# Altium schematic sheet MP_CTRL1.SchDoc
size A3; SheetNumber: 5; SheetTotal: 16
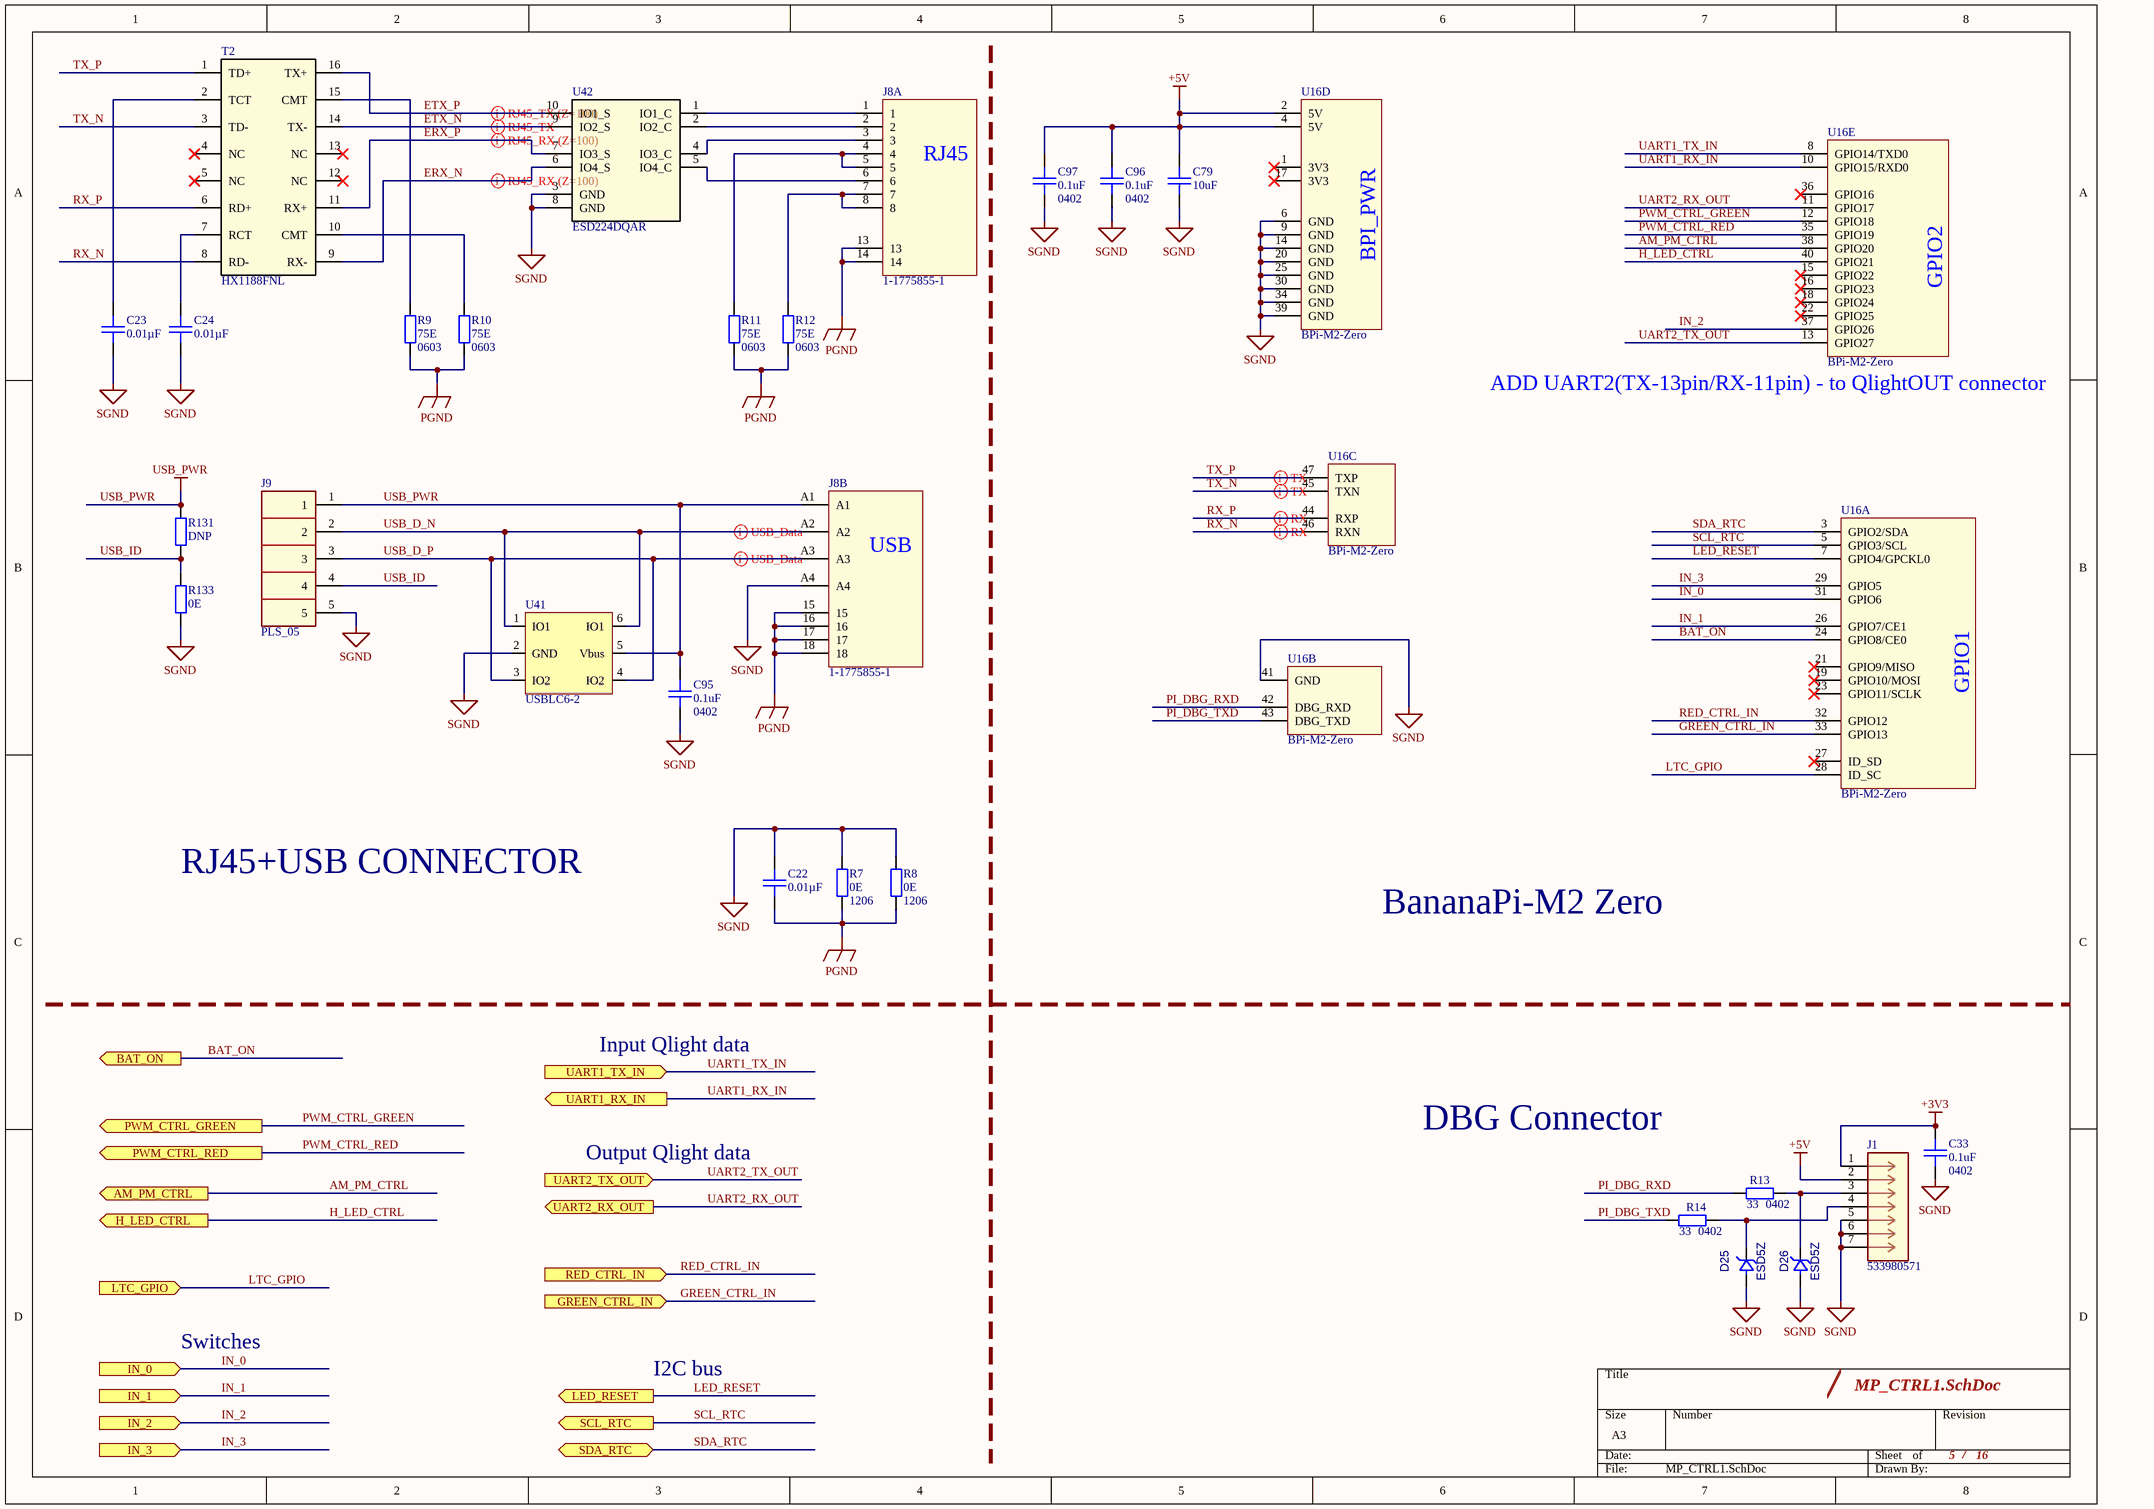
[diagram p0: MP_CTRL1.SchDoc]

## Parts
C22  Capacitance: 0.01µF  [CAPC340180_140N_KEM]  (hidden comment: C1206C103K2REC7800)
C23  Capacitance: 0.01µF  [CAPC340180_140N_KEM]  (hidden comment: C1206C103K2REC7800)
C24  Capacitance: 0.01µF  [CAPC340180_140N_KEM]  (hidden comment: C1206C103K2REC7800)
C33  Capacitance: 0.1uF  Package1: 0402  [CAPC100x50x50L25]  (hidden comment: 04023C104KAT2A)
C79  Capacitance: 10uF  [CAPC200X125X125L50]  (hidden comment: 0805W106K250CC)
C95  Capacitance: 0.1uF  Package1: 0402  [CAPC100x50x50L25]  (hidden comment: 04023C104KAT2A)
C96  Capacitance: 0.1uF  Package1: 0402  [CAPC100x50x50L25]  (hidden comment: 04023C104KAT2A)
C97  Capacitance: 0.1uF  Package1: 0402  [CAPC100x50x50L25]  (hidden comment: 04023C104KAT2A)
D25  ESD5Z  [SOD-523]
D26  ESD5Z  [SOD-523]
J1  533980571  [CON_533980571]
J8  1-1775855-1  [CONN12_1-1775855-1_TEC]  (parts A,B of 2)
J9  PLS_05  [PLS-05]
R7  Resistance: 0E  Size2: 1206  [RESC3116X06N]  (hidden comment: RC1206JR-070RL)
R8  Resistance: 0E  Size2: 1206  [RESC3116X06N]  (hidden comment: RC1206JR-070RL)
R9  Resistance: 75E  Size2: 0603  [RESC160X80X55L30]  (hidden comment: RC0603FR-0775RP)
R10  Resistance: 75E  Size2: 0603  [RESC160X80X55L30]  (hidden comment: RC0603FR-0775RP)
R11  Resistance: 75E  Size2: 0603  [RESC160X80X55L30]  (hidden comment: RC0603FR-0775RP)
R12  Resistance: 75E  Size2: 0603  [RESC160X80X55L30]  (hidden comment: RC0603FR-0775RP)
R13  Resistance: 33  Package2: 0402  [RESC100X50X40L25]  (hidden comment: RC0402FR-0733RL)
R14  Resistance: 33  Package2: 0402  [RESC100X50X40L25]  (hidden comment: RC0402FR-0733RL)
R131  DNP  [RESC100X50X40L25]
R133  Resistance: 0E  [RESC100X50X40L25]  (hidden comment: AC0402JR-070RL)
T2  HX1188FNL  [SOIC16_HX1188_PUL]
U16  BPi-M2-Zero  [BPi-M2-Zero]  (parts A,B,C,D,E of 5)
U41  USBLC6-2  [SOT23-6]
U42  ESD224DQAR  [DQA0010A]

## Ports
AM_PM_CTRL (out), BAT_ON (out), GREEN_CTRL_IN (in), H_LED_CTRL (out), IN_0 (in), IN_1 (in), IN_2 (in), IN_3 (in), LED_RESET (out), LTC_GPIO (in), PWM_CTRL_GREEN (out), PWM_CTRL_RED (out), RED_CTRL_IN (in), SCL_RTC (out), SDA_RTC (bidir), UART1_RX_IN (out), UART1_TX_IN (in), UART2_RX_OUT (out), UART2_TX_OUT (in)

## Nets
+3V3: C33.2 J1.1
+5V: C79.2 C96.2 C97.2 J1.2 U16.2(5V) U16.4(5V)
PGND: C22.1 J8.13 J8.14 J8.15 J8.16 J8.17 J8.18 R7.1 R8.1 R9.1 R10.1 R11.1 R12.1
SGND: C22.2 C23.1 C24.1 C33.1 C79.1 C95.1 C96.1 C97.1 D25.2(A) D26.2(A) J1.5 J1.6 J1.7 J8.A4 J9.5 R7.2 R8.2 R133.1 U16.6(GND) U16.9(GND) U16.14(GND) U16.20(GND) U16.25(GND) U16.30(GND) U16.34(GND) U16.39(GND) U16.41(GND) U41.2(GND) U42.3(GND) U42.8(GND)
USB_PWR: C95.2 J8.A1 J9.1 R131.2 U41.5(Vbus)
AM_PM_CTRL: U16.38(GPIO20) ; port AM_PM_CTRL
BAT_ON: U16.24(GPIO8/CE0) ; port BAT_ON
ERX_N: T2.9(RX-) U42.6(IO4_S)
ERX_P: T2.11(RX+) U42.7(IO3_S)
ETX_N: T2.14(TX-) U42.9(IO2_S)
ETX_P: T2.16(TX+) U42.10(IO1_S)
GREEN_CTRL_IN: U16.33(GPIO13) ; port GREEN_CTRL_IN
H_LED_CTRL: U16.40(GPIO21) ; port H_LED_CTRL
IN_0: U16.31(GPIO6) ; port IN_0
IN_1: U16.26(GPIO7/CE1) ; port IN_1
IN_2: U16.37(GPIO26) ; port IN_2
IN_3: U16.29(GPIO5) ; port IN_3
LED_RESET: U16.7(GPIO4/GPCKL0) ; port LED_RESET
LTC_GPIO: U16.28(ID_SC) ; port LTC_GPIO
PI_DBG_RXD: R13.2 U16.42(DBG_RXD)
PI_DBG_TXD: R14.2 U16.43(DBG_TXD)
PWM_CTRL_GREEN: U16.12(GPIO18) ; port PWM_CTRL_GREEN
PWM_CTRL_RED: U16.35(GPIO19) ; port PWM_CTRL_RED
RED_CTRL_IN: U16.32(GPIO12) ; port RED_CTRL_IN
RX_N: T2.8(RD-) U16.46(RXN)
RX_P: T2.6(RD+) U16.44(RXP)
SCL_RTC: U16.5(GPIO3/SCL) ; port SCL_RTC
SDA_RTC: U16.3(GPIO2/SDA) ; port SDA_RTC
TX_N: T2.3(TD-) U16.45(TXN)
TX_P: T2.1(TD+) U16.47(TXP)
UART1_RX_IN: U16.10(GPIO15/RXD0) ; port UART1_RX_IN
UART1_TX_IN: U16.8(GPIO14/TXD0) ; port UART1_TX_IN
UART2_RX_OUT: U16.11(GPIO17) ; port UART2_RX_OUT
UART2_TX_OUT: U16.13(GPIO27) ; port UART2_TX_OUT
USB_D_N: J8.A2 J9.2 U41.1(IO1) U41.6(IO1)
USB_D_P: J8.A3 J9.3 U41.3(IO2) U41.4(IO2)
USB_ID: J9.4 R131.1 R133.2
NetC23_2: C23.2 T2.2(TCT)
NetC24_2: C24.2 T2.7(RCT)
NetD25_1: D25.1(K) J1.4 R14.1
NetD26_1: D26.1(K) J1.3 R13.1
NetJ8_1: J8.1 U42.1(IO1_C)
NetJ8_2: J8.2 U42.2(IO2_C)
NetJ8_3: J8.3 U42.4(IO3_C)
NetJ8_4: J8.4 J8.5 R11.2
NetJ8_6: J8.6 U42.5(IO4_C)
NetJ8_7: J8.7 J8.8 R12.2
NetR9_2: R9.2 T2.15(CMT)
NetR10_2: R10.2 T2.10(CMT)

Not connected (* = marked no-connect by the designer): T2 4(NC)* 5(NC)* 12(NC)* 13(NC)*; U16 1(3V3)* 15(GPIO22)* 16(GPIO23)* 17(3V3)* 18(GPIO24)* 19(GPIO10/MOSI)* 21(GPIO9/MISO)* 22(GPIO25)* 23(GPIO11/SCLK)* 27(ID_SD)* 36(GPIO16)*

## Layout directives
differential pair: ERX_N, ERX_P, ETX_N, ETX_P, RX_N, RX_P, TX_N, TX_P, USB_D_N, USB_D_P

## Notes on the sheet
- (near U16) ADD UART2(TX-13pin/RX-11pin) - to QlightOUT connector
- RJ45+USB CONNECTOR
- BananaPi-M2 Zero
- Input Qlight data
- Output Qlight data
- DBG Connector
- Switches
- I2C bus
- /
- (in symbol 1-1775855-1, part A) RJ45
- (in symbol 1-1775855-1, part B) USB
- (in symbol BPi-M2-Zero, part A) GPIO1
- (in symbol BPi-M2-Zero, part D) BPI_PWR
- (in symbol BPi-M2-Zero, part E) GPIO2

## Library data of the parts
C22-C24 = CAP_1206: CAP CER 1206 10NF 200V X7R 10%; Manufacturer: YAGEO; Op Temp max: 85°C; Op Temp min: -55°C; ComponentLink3URL: https://www.digikey.com/en/products/detail/kemet/C1206C104K2REC7210/8645679; MPN: C1206C103K2REC7800; ComponentLink1URL: https://connect.kemet.com:7667/gateway/IntelliData-ComponentDocumentation/1.0/download/datasheet/C1206C104K2REC7210; Package: 1206 (3216 Metric); Size: 3.20mm x 1.60mm; Height max: 700µm; Mounting Type: SM; Tolerance: 10%; ComponentLink1Description: Datasheet; ComponentLink3Description: Digikey; Ratings: -; Dielectric: X7R; Lead Spacing: 0mm; Component Type: Ceramic Capacitor; Voltage Rating: 200V
C33 C95-C97 = CMP-001-0374-4: 0402 25V X7R 100 NF 10%; Manufacturer: KYOCERA AVX; Op Temp max: 85°C; Op Temp min: -55°C; ComponentLink3URL: https://www.digikey.com/en/products/detail/yageo/CC0402MRX5R5BB106/5195138; MPN: 04023C104KAT2A; ComponentLink1URL: https://www.yageo.com/upload/media/product/productsearch/datasheet/mlcc/UPY-GPHC_X5R_4V-to-50V_26.pdf; Package: 0402 (1005 Metric); Size: 1.00mm x 0.50mm; Height max: 700µm; Mounting Type: SM; Tolerance: 10%; ComponentLink1Description: Datasheet; ComponentLink3Description: Digikey; Ratings: -; Dielectric: X7R; ComponentLink2Description: Mouser; ComponentLink2URL: https://eu.mouser.com/ProductDetail/YAGEO/CC0402MRX5R5BB106?qs=zEY9bCHj09eCmUJdZuS5Lg%3D%3D; Lead Spacing: 0mm; Component Type: Ceramic Capacitor; Voltage Rating: 25V
C79 = CMP-001-1415-2: CAP SMD 0805 X5R 10UF 10% 25V; Op Temp max: 125°C; Dielectric: X7R; Op Temp min: -55°C; Voltage Rating: 25V; ComponentLink1URL: https://mm.digikey.com/Volume0/opasdata/d220001/medias/docus/5660/3372_0805W106K250CC.pdf; ComponentLink3URL: https://www.digikey.com/en/products/detail/nextgen-components/0805W106K250CC/18676983; Mounting Type: SM; MPN: 0805W106K250CC; Package: 0805 (2012 Metric); ComponentLink3Description: Digikey; ComponentLink1Description: Datasheet; Tolerance: ±10%; Component Type: Ceramic Capacitor
D25 D26 = ESD5Z3.3T1: TVS DIODE 3.3VWM 14.1VC SOD523; MPN: ESD5Z3.3T1G/T5G; Type: Zener; Voltage - Reverse Standoff (Typ): 3.3V (Max); Voltage - Breakdown (Min): 5V; Voltage - Clamping (Max) @ Ipp: 14.1V; Capacitance @ Frequency: 105pF @ 1MHz; Temperature MIN: -55°C; Temperature MAX: 150°C; Package: SC-79, SOD-523; ComponentLink1Description: Datasheet; ComponentLink1URL: https://www.onsemi.com/pdf/datasheet/esd5z2.5t1-d.pdf; ComponentLink2Description: DigiKey; ComponentLink2URL: https://www.digikey.com/en/products/detail/onsemi/esd5z3-3t1/1476606
J1 = Con_533980571: CONN HEADER SMD 5POS 1.25MM; Mfr_Name: Molex Connector Corporation; Positions: 5; Manufacturer_Part_Number: 533980571; ComponentLink1Description: DigiKey; ComponentLink1URL: https://www.digikey.ee/en/products/detail/molex/0533980571/699069?s=N4IgTCBcDaIKwGYEE4AcAGOB2AjCAugL5A; ComponentLink2Description: MN; ComponentLink2URL: https://www.molex.com/en-us/products/part-detail/533980571; ComponentLink3Description: Datasheet; ComponentLink3URL: https://tools.molex.com/pdm_docs/sd/533980571_sd.pdf
J8 = 1-1775855-1: CONN MOD JACK 8P8C R/A SHIELDED; MFN: TE Connectivity; Type1: RefDes; Type: RJ45+USB -A; Copyright: Copyright (C) 2024 Ultra Librarian. All rights reserved.; MPN: 1-1775855-1
R7 R8 = RC_1206: RES 0 OHM JUMPER 1/4W 1206; MF: YAGEO; Power: 0.25W; Datasheet: https://www.yageo.com/upload/media/product/products/datasheet/rchip/PYu-RC_Group_51_RoHS_L_12.pdf; DigiKey: https://www.digikey.com/en/products/detail/yageo/RC1206JR-070RL/729184; Package: 1206 (3216 Metric); MPN: RC1206JR-070RL
R9-R12 = CMP-001-0628-7: RES 75 OHM 1% 1/10W 0603; Manufacturer: YAGEO; Power: 100mW; Temperature Coefficient: ±100ppm; Op Temp max: 155°C; Op Temp min: -55°C; PMNT: DNP; Ratings: -; ComponentLink3URL: https://www.digikey.com/en/products/detail/yageo/RC0603FR-0710KL/726880?s=N4IgTCBcDaIEoGEAMA2JBmAYnAtEg7AIxIDSAMiALoC%2BQA; Size: 1.60mm x 0.80mm; ComponentLink1Description: Datasheet; ComponentLink3Description: Digikey; ComponentLink2Description: Mouser; ComponentLink1URL: https://www.yageo.com/upload/media/product/products/datasheet/rchip/PYu-RC_51_RoHS_P_4.pdf; Composition: Thick Film; Package: 0603 (1608 Metric); ComponentLink2URL: https://eu.mouser.com/ProductDetail/YAGEO/RC0603FR-0710KL?qs=grNVn54RoB%252B3GtjbJj3wJQ%3D%3D; Mounting Type: SM; Tolerance: 1%; Height max: 550µm; MPN: RC0603FR-0775RP; Component Type: Chip Resistor
R13 R14 = CMP-001-0484-6: RES 33 OHM 1% 1/16W 0402; Manufacturer: YAGEO; Power: 63mW; Op Temp min: -55°C; Temperature Coefficient: ±100ppm; Op Temp max: 155°C; ComponentLink3URL: https://www.digikey.com/en/products/detail/yageo/RC0402FR-0727RL/5280946; ComponentLink2Description: Mouser; Ratings: -; Tolerance: 1%; Height max: 400µm; MPN: RC0402FR-0733RL; ComponentLink1URL: https://www.yageo.com/upload/media/product/productsearch/datasheet/rchip/PYu-RC_Group_51_RoHS_L_12.pdf; Size: 1.00mm x 0.50mm; Composition: Thick Film; Package: 0402 (1005 Metric); ComponentLink3Description: Digikey; Mounting Type: SM; ComponentLink2URL: https://eu.mouser.com/ProductDetail/YAGEO/RC0402FR-0727RL?qs=UOUeRUa%252B8Wlb37UyFHw9Bw%3D%3D; ComponentLink1Description: Datasheet; Component Type: Chip Resistor
R131 = CMP-001-0484-6: RES SMD 0 OHM JUMPER 1/16W 0402; Manufacturer: YAGEO; Power: 63mW; Op Temp min: -55°C; Temperature Coefficient: ±100ppm; Resistance: 0; Op Temp max: 155°C; ComponentLink3URL: https://www.digikey.com/en/products/detail/yageo/RC0402FR-0727RL/5280946; ComponentLink2Description: Mouser; Ratings: -; Tolerance: Jumper; Height max: 400µm; MPN: DNP; ComponentLink1URL: https://www.yageo.com/upload/media/product/productsearch/datasheet/rchip/PYu-RC_Group_51_RoHS_L_12.pdf; Size: 1.00mm x 0.50mm; Composition: Thick Film; Package: 0402 (1005 Metric); ComponentLink3Description: Digikey; Mounting Type: SM; ComponentLink2URL: https://eu.mouser.com/ProductDetail/YAGEO/RC0402FR-0727RL?qs=UOUeRUa%252B8Wlb37UyFHw9Bw%3D%3D; ComponentLink1Description: Datasheet; Component Type: Chip Resistor
R133 = CMP-001-0484-6: RES SMD 0 OHM JUMPER 1/16W 0402; Manufacturer: YAGEO; Power: 63mW; Op Temp min: -55°C; Temperature Coefficient: ±100ppm; Op Temp max: 155°C; ComponentLink3URL: https://www.digikey.com/en/products/detail/yageo/RC0402FR-0727RL/5280946; ComponentLink2Description: Mouser; Ratings: -; Tolerance: Jumper; Height max: 400µm; MPN: AC0402JR-070RL; ComponentLink1URL: https://www.yageo.com/upload/media/product/productsearch/datasheet/rchip/PYu-RC_Group_51_RoHS_L_12.pdf; Size: 1.00mm x 0.50mm; Composition: Thick Film; Package: 0402 (1005 Metric); ComponentLink3Description: Digikey; Mounting Type: SM; ComponentLink2URL: https://eu.mouser.com/ProductDetail/YAGEO/RC0402FR-0727RL?qs=UOUeRUa%252B8Wlb37UyFHw9Bw%3D%3D; ComponentLink1Description: Datasheet; Component Type: Chip Resistor
T2 = HX1188FNL: MODULE XFRMR SGL ETHR LAN 16SOIC; Mfr_Name: Pulse Electronics Corporation; Type: DEV; Copyright: Copyright (C) 2024 Ultra Librarian. All rights reserved.; MPN: HX1188FNL; RefDes: RefDes; ComponentLink1Description: DigiKey; ComponentLink1URL: https://www.digikey.com/en/products/detail/pulse-electronics/HX1188/754321
U16 = BPi-M2-Zero: Single board computer; ComponentLink1Description: Datasheet; ComponentLink1URL: https://wiki.banana-pi.org/Banana_Pi_BPI-M2_ZERO
U42 = ESD224DQAR: TVS DIODE 3.6VWM 14VC 10USON; Mfr_Name: Texas Instruments; Type: DEV; RefDes: RefDes; Copyright: Copyright (C) 2024 Ultra Librarian. All rights reserved.; MPN: ESD224DQAR; ComponentLink1Description: DigiKey; ComponentLink1URL: https://www.digikey.com/en/products/detail/texas-instruments/esd224dqar/8601783; ComponentLink2Description: Datashet; ComponentLink2URL: https://www.ti.com/general/docs/suppproductinfo.tsp?distId=10&gotoUrl=https%3A%2F%2Fwww.ti.com%2Flit%2Fgpn%2Fesd224